# Altium schematic sheet Main.SchDoc: Main Schematic
size A4; ApprovedBy: LD Stanton; Author: LD Stanton; DrawnBy: LD Stanton; Engineer: LD Stanton; Organization: University of Cape Town; Address1: Department of Electrical Engineering; Address2: Menzies Building, Upper Campus; Address3: Cape Town, South Africa; Address4: 7701; DocumentNumber: 1; SheetNumber: 1; SheetTotal: 14; Project_Name: SISPS-BATT Interposer
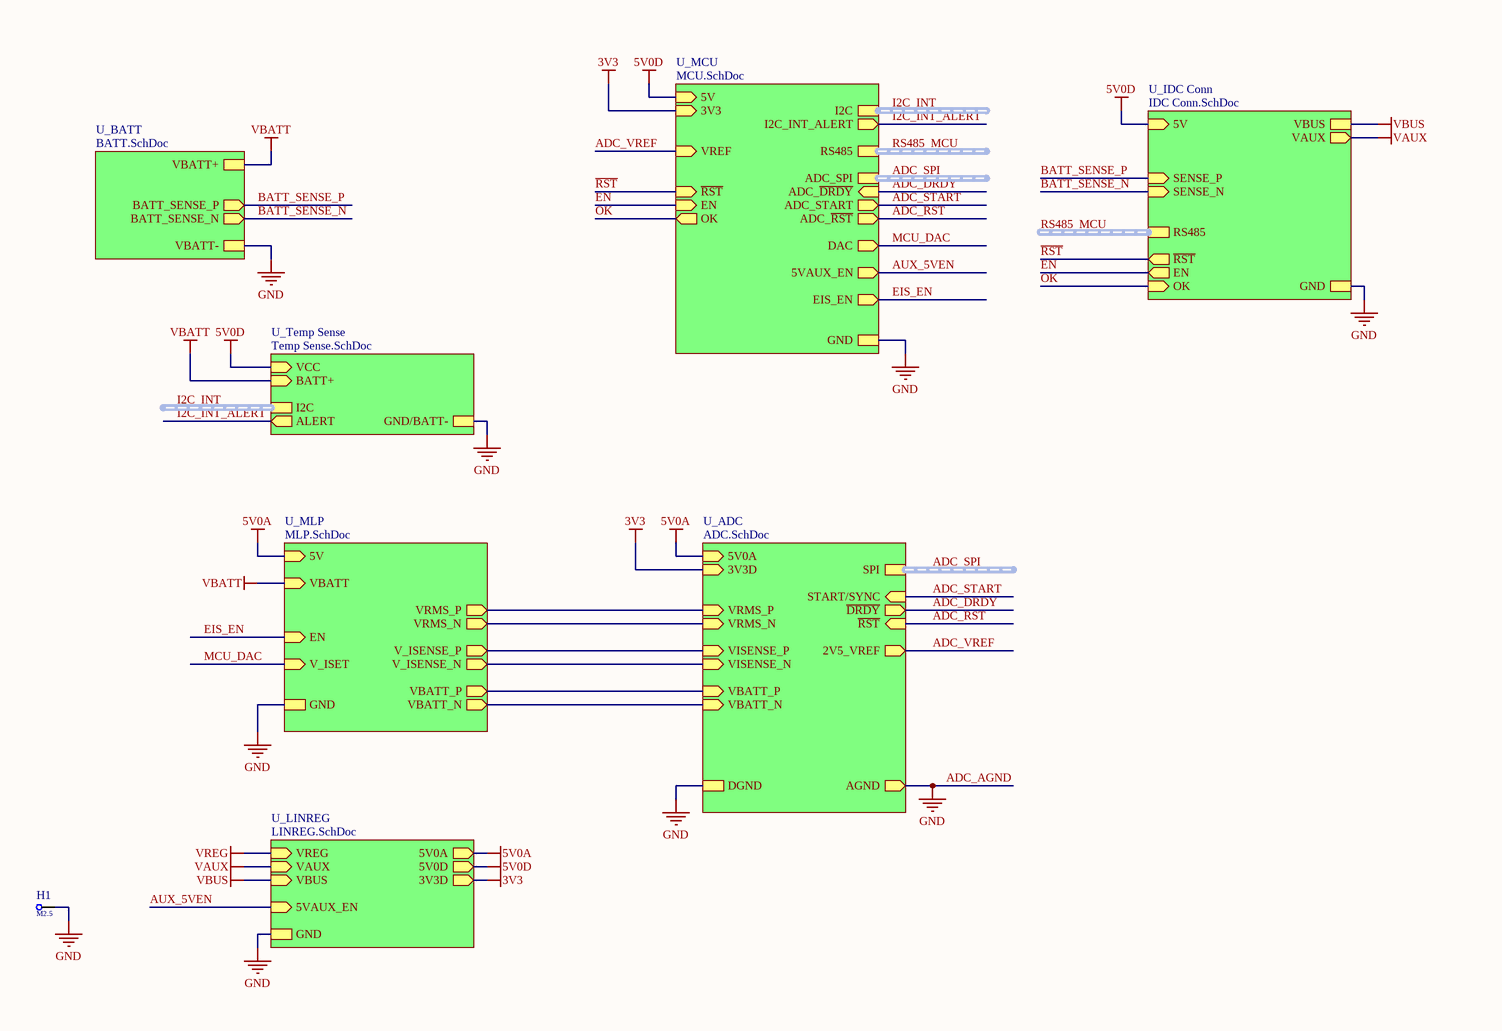
[diagram p0: Main.SchDoc, left]

## Parts
H1  Size: M2.5  [Mounting Hole M2.5 Plated Tight Via]  (hidden comment: Mounting Hole M2.5)  (no BOM)

## Sub-sheets
U_ADC = ADC.SchDoc: SPI (harness SPI), ~{RST} (in), ~{DRDY} (out), 5V0A (in), 3V3D (in), START/SYNC (in), VRMS_P (in), VRMS_N (in), DGND, AGND (out), VISENSE_P (in), VISENSE_N (in), VBATT_P (in), VBATT_N (in), 2V5_VREF (out)
U_BATT = BATT.SchDoc: BATT_SENSE_P (out), BATT_SENSE_N (out), VBATT+, VBATT-
U_IDC Conn = IDC Conn.SchDoc: VAUX (out), VBUS, GND, ~{RST} (out), EN (out), OK (in), SENSE_P (in), SENSE_N (in), 5V (in), RS485 (harness RS485)
U_LINREG = LINREG.SchDoc: VREG (in), VAUX (in), VBUS (in), 5V0A (out), 5V0D (out), 3V3D (out), GND, 5VAUX_EN (in)
U_MCU = MCU.SchDoc: I2C_INT_ALERT (out), 3V3 (in), GND, I2C (harness I2C), ~{RST} (in), ADC_SPI (harness SPI), ADC_~{DRDY} (in), ADC_START (out), ADC_~{RST} (out), VREF (in), DAC (out), RS485 (harness RS485), 5V (in), 5VAUX_EN (out), EN (in), OK (out), EIS_EN (out)
U_MLP = MLP.SchDoc: 5V (in), VBATT (in), GND, VRMS_P (out), VRMS_N (out), V_ISET (in), V_ISENSE_P (out), V_ISENSE_N (out), VBATT_P (out), EN (in), VBATT_N (out)
U_Temp Sense = Temp Sense.SchDoc: I2C (harness I2C), ALERT (out), BATT+ (in), VCC (in), GND/BATT-

## Nets
3V3: sheet U_MCU/3V3, sheet U_ADC/3V3D, sheet U_LINREG/3V3D
5V0A: sheet U_MLP/5V, sheet U_ADC/5V0A, sheet U_LINREG/5V0A
5V0D: sheet U_Temp Sense/VCC, sheet U_MCU/5V, sheet U_IDC Conn/5V, sheet U_LINREG/5V0D
ADC_AGND: H1.1 ; sheet U_Temp Sense/GND/BATT-, sheet U_MCU/GND, sheet U_IDC Conn/GND, sheet U_MLP/GND, sheet U_ADC/DGND, sheet U_ADC/AGND, sheet U_LINREG/GND, sheet U_BATT/VBATT-  [also labelled GND]
VAUX: sheet U_IDC Conn/VAUX, sheet U_LINREG/VAUX
VBATT: sheet U_Temp Sense/BATT+, sheet U_MLP/VBATT, sheet U_BATT/VBATT+
VBUS: sheet U_IDC Conn/VBUS, sheet U_LINREG/VBUS
VREG: sheet U_LINREG/VREG
~{RST}: sheet U_MCU/~{RST}, sheet U_IDC Conn/~{RST}
ADC_~{DRDY}: sheet U_MCU/ADC_~{DRDY}, sheet U_ADC/~{DRDY}
ADC_~{RST}: sheet U_MCU/ADC_~{RST}, sheet U_ADC/~{RST}
ADC_START: sheet U_MCU/ADC_START, sheet U_ADC/START/SYNC
ADC_VREF: sheet U_MCU/VREF, sheet U_ADC/2V5_VREF
AUX_5VEN: sheet U_MCU/5VAUX_EN, sheet U_LINREG/5VAUX_EN
BATT_SENSE_N: sheet U_IDC Conn/SENSE_N, sheet U_BATT/BATT_SENSE_N
BATT_SENSE_P: sheet U_IDC Conn/SENSE_P, sheet U_BATT/BATT_SENSE_P
EIS_EN: sheet U_MCU/EIS_EN, sheet U_MLP/EN
EN: sheet U_MCU/EN, sheet U_IDC Conn/EN
I2C_INT_ALERT: sheet U_Temp Sense/ALERT, sheet U_MCU/I2C_INT_ALERT
MCU_DAC: sheet U_MCU/DAC, sheet U_MLP/V_ISET
OK: sheet U_MCU/OK, sheet U_IDC Conn/OK
(unnamed): sheet U_MLP/VRMS_P, sheet U_ADC/VRMS_P
(unnamed): sheet U_MLP/VRMS_N, sheet U_ADC/VRMS_N
(unnamed): sheet U_MLP/V_ISENSE_P, sheet U_ADC/VISENSE_P
(unnamed): sheet U_MLP/V_ISENSE_N, sheet U_ADC/VISENSE_N
(unnamed): sheet U_MLP/VBATT_P, sheet U_ADC/VBATT_P
(unnamed): sheet U_MLP/VBATT_N, sheet U_ADC/VBATT_N

## Buses and harness runs
harness ADC_SPI = sheet U_ADC/SPI
harness ADC_SPI = sheet U_MCU/ADC_SPI
harness I2C_INT = sheet U_MCU/I2C
harness I2C_INT = sheet U_Temp Sense/I2C
harness RS485_MCU = sheet U_IDC Conn/RS485
harness RS485_MCU = sheet U_MCU/RS485

## Notes on the sheet
- © =CopyrightHolder =CopyrightYear
- This project and information contained within is the copyright property of the author. All rights are reserved. No warranty is given. No liability is assumed. Confidential unless licenced.
- Licence:
- Engineer:
- Checker:
- Approvals
- Date
- PCB Doc:
- ASM Doc:
- FAB Doc:
- CPL Doc:
- Reference Documents
- Size:
- Date:
- A4
- Number:
- Time:
- Revision:
- Sheet
- of
- BOM Doc:
- File:
- Author:

## Library data of the parts
H1 = CMP-00028-00005-3: M2.5 Mounting Hole